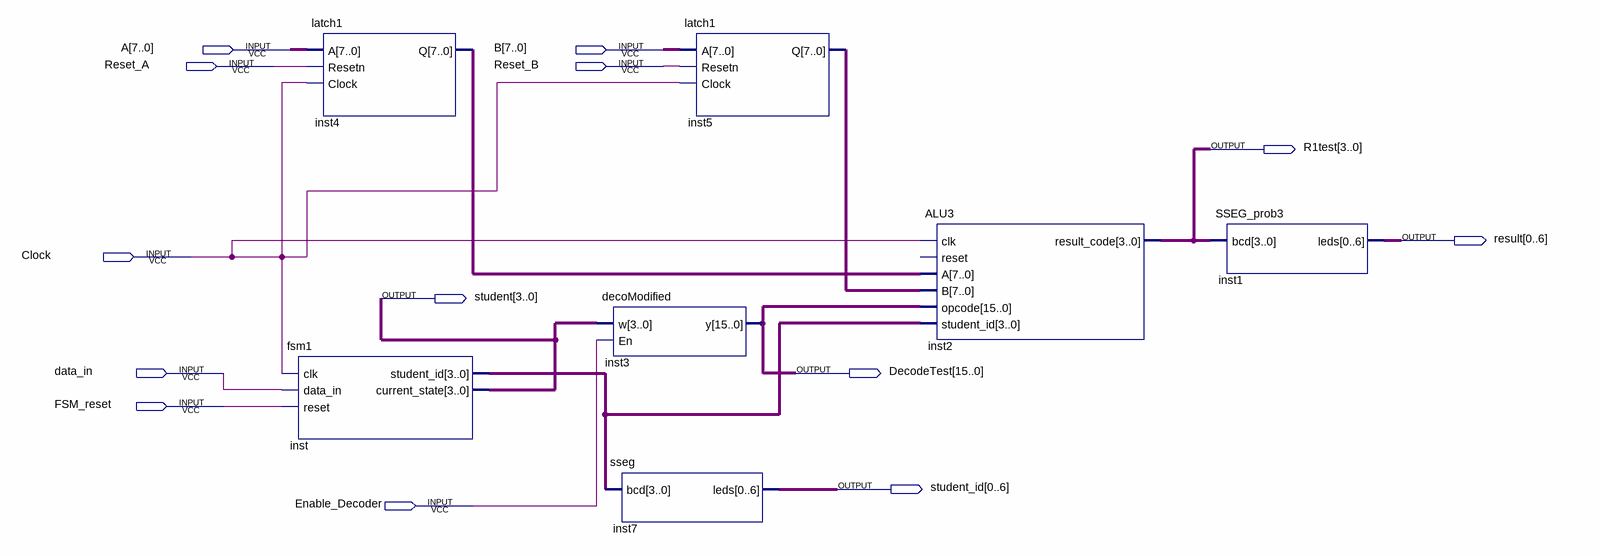
[diagram p0: schematic sheet]
// Quartus schematic problem3.bdf as structural Verilog: 7 symbols, 13 pins
module problem3 (
  input  [7:0] A,
  input  [7:0] B,
  input  Reset_A,
  input  Reset_B,
  input  Clock,
  input  data_in,
  input  FSM_reset,
  input  Enable_Decoder,
  output [3:0] R1test,
  output [0:6] result,
  output [3:0] student,
  output [15:0] DecodeTest,
  output [0:6] student_id
);

  wire [3:0] inst_student_id;
  wire [7:0] inst4_q, inst5_q;

  latch1 inst4 (.A(A), .Resetn(Reset_A), .Clock(Clock), .Q(inst4_q));
  fsm1 inst (.clk(Clock), .data_in(data_in), .reset(FSM_reset), .student_id(inst_student_id), .current_state(student));
  decoModified inst3 (.w(student), .En(Enable_Decoder), .y(DecodeTest));
  sseg inst7 (.bcd(inst_student_id), .leds(student_id));
  latch1 inst5 (.A(B), .Resetn(Reset_B), .Clock(Clock), .Q(inst5_q));
  ALU3 inst2 (
    .clk(Clock), .A(inst4_q), .B(inst5_q), .opcode(DecodeTest), .student_id(inst_student_id),
    .result_code(R1test));  // open: reset
  SSEG_prob3 inst1 (.bcd(R1test), .leds(result));
endmodule
